# EasyEDA Pro project LED_board.epro

# Schematic Schematic1
Create Date: 2024-09-07; Page Name: P1; Project Name: led_ear; Schematic Name: Schematic1; Update Date: 2024-09-07; Company: 嘉立创EDA; Page Size: A3; Version: V1.0
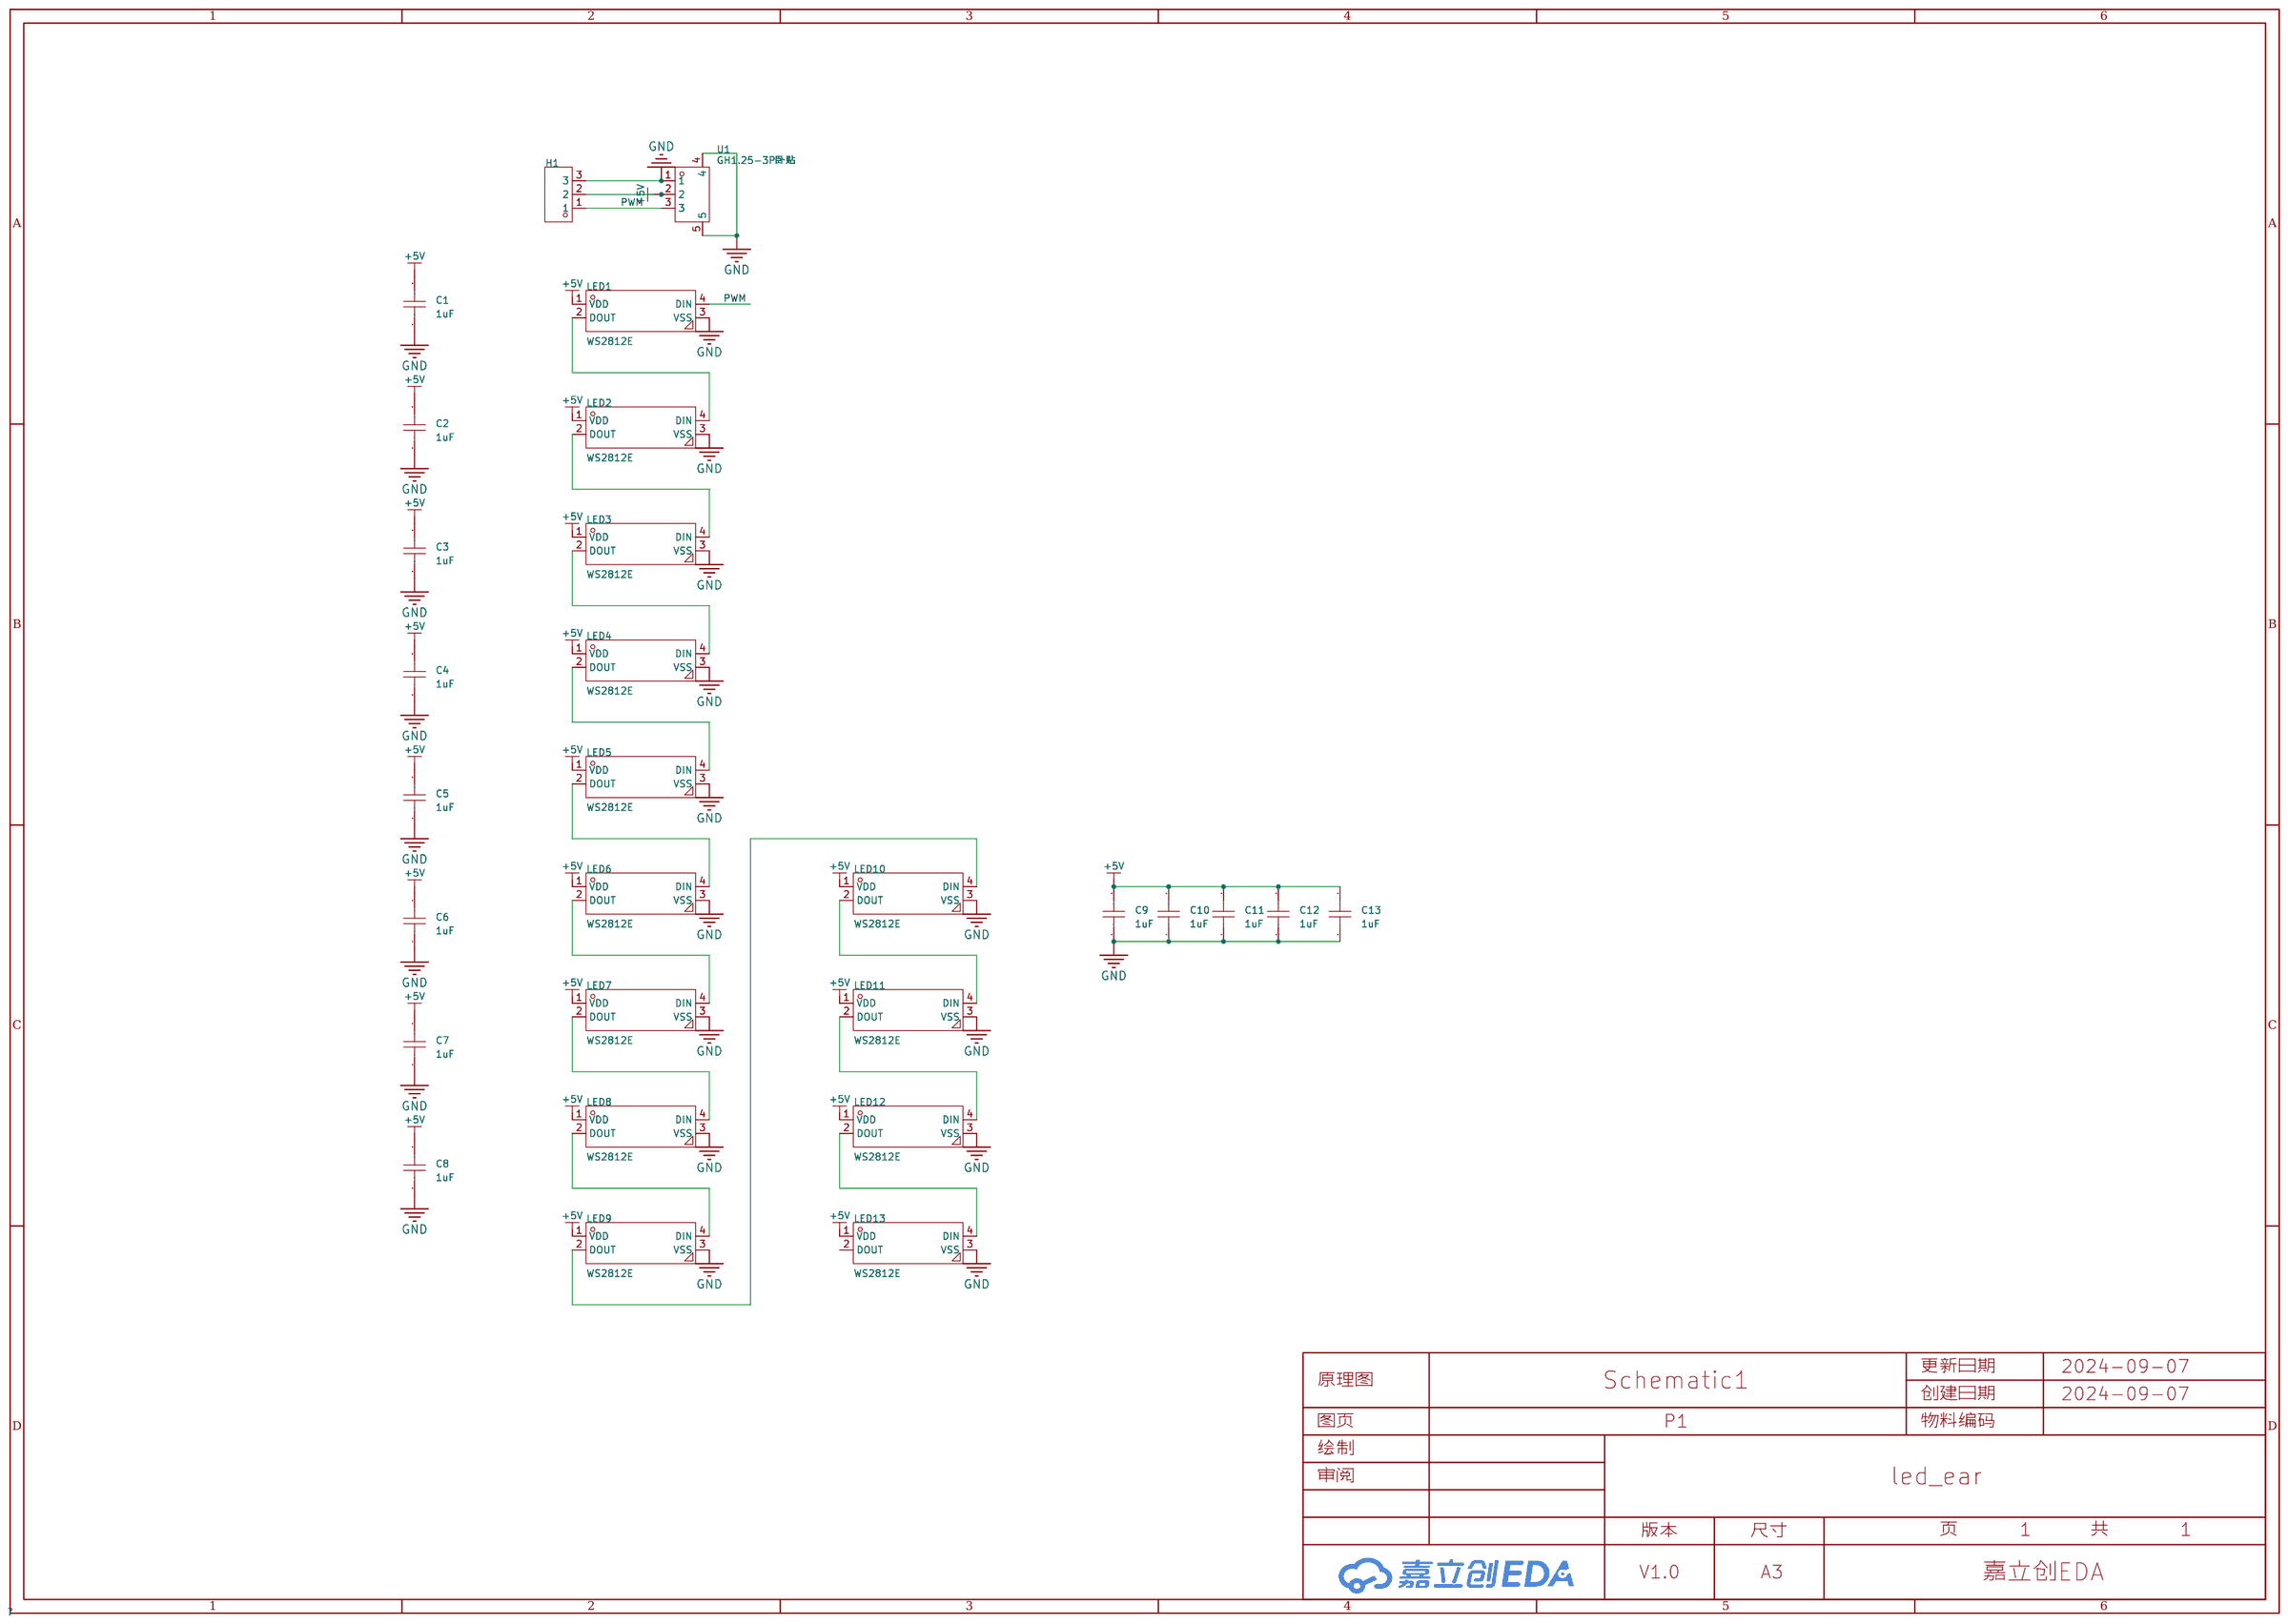
[diagram p0: schematic sheet]

## Parts
C1  1uF  [C0603]
C2  1uF  [C0603]
C3  1uF  [C0603]
C4  1uF  [C0603]
C5  1uF  [C0603]
C6  1uF  [C0603]
C7  1uF  [C0603]
C8  1uF  [C0603]
C9  1uF  [C0603]
C10  1uF  [C0603]
C11  1uF  [C0603]
C12  1uF  [C0603]
C13  1uF  [C0603]
H1  -  [HDR-TH_3P-P2.54-V-M]
LED1  WS2812E  [LED-SMD_4P-L5.0-W5.0-BL_TC5050RGB]
LED2  WS2812E  [LED-SMD_4P-L5.0-W5.0-BL_TC5050RGB]
LED3  WS2812E  [LED-SMD_4P-L5.0-W5.0-BL_TC5050RGB]
LED4  WS2812E  [LED-SMD_4P-L5.0-W5.0-BL_TC5050RGB]
LED5  WS2812E  [LED-SMD_4P-L5.0-W5.0-BL_TC5050RGB]
LED6  WS2812E  [LED-SMD_4P-L5.0-W5.0-BL_TC5050RGB]
LED7  WS2812E  [LED-SMD_4P-L5.0-W5.0-BL_TC5050RGB]
LED8  WS2812E  [LED-SMD_4P-L5.0-W5.0-BL_TC5050RGB]
LED9  WS2812E  [LED-SMD_4P-L5.0-W5.0-BL_TC5050RGB]
LED10  WS2812E  [LED-SMD_4P-L5.0-W5.0-BL_TC5050RGB]
LED11  WS2812E  [LED-SMD_4P-L5.0-W5.0-BL_TC5050RGB]
LED12  WS2812E  [LED-SMD_4P-L5.0-W5.0-BL_TC5050RGB]
LED13  WS2812E  [LED-SMD_4P-L5.0-W5.0-BL_TC5050RGB]
U1  GH1.25-3P卧贴  [CONN-SMD_GH1.25-3P]

## Library data of the parts
C1-C13 = CL10A105KB8NNNC: 容值:1uF;精度:±10%;额定电压:50V;材质(温度系数):X5R;; LCSC Part Name: 1uF ±10% 50V; Supplier Part: C15849; Manufacturer: SAMSUNG(三星); Supplier Footprint: 0603; JLCPCB Part Class: Basic Part; Datasheet: https://atta.szlcsc.com/upload/public/pdf/source/20160218/1457707763339.pdf; Supplier: LCSC; Tolerance: ±10%; Voltage Rated: 50V; Temperature Coefficient: X5R
H1 = HDR-M_2.54_1x3P: Supplier Part: C2937625; Supplier Footprint: 插件
LED1-LED13 = WS2812E: （注意防潮，请查阅规格书中对应具体内容）; Supplier Part: C139127; Manufacturer: worldsemi; Supplier Footprint: SMD5050; JLCPCB Part Class: 扩展库; Datasheet: https://atta.szlcsc.com/upload/public/pdf/source/20191217/C473063_1AFA2F5FD6E31E5FA7E7F342219CDFCF.pdf; Supplier: LCSC
U1 = GH1.25-3P卧贴: Supplier Part: C9900014671; JLCPCB Part Class: 扩展库; Supplier: LCSC

## Nets
+5V: C1.2 C2.2 C3.2 C4.2 C5.2 C6.2 C7.2 C8.2 C9.2 C10.2 C11.2 C12.2 C13.2 H1.2 LED1.1(VDD) LED2.1(VDD) LED3.1(VDD) LED4.1(VDD) LED5.1(VDD) LED6.1(VDD) LED7.1(VDD) LED8.1(VDD) LED9.1(VDD) LED10.1(VDD) LED11.1(VDD) LED12.1(VDD) LED13.1(VDD) U1.2
GND: C1.1 C2.1 C3.1 C4.1 C5.1 C6.1 C7.1 C8.1 C9.1 C10.1 C11.1 C12.1 C13.1 H1.3 LED1.3(VSS) LED2.3(VSS) LED3.3(VSS) LED4.3(VSS) LED5.3(VSS) LED6.3(VSS) LED7.3(VSS) LED8.3(VSS) LED9.3(VSS) LED10.3(VSS) LED11.3(VSS) LED12.3(VSS) LED13.3(VSS) U1.1 U1.4 U1.5
PWM: H1.1 LED1.4(DIN) U1.3
$1N233: LED1.2(DOUT) LED2.4(DIN)
$1N304: LED2.2(DOUT) LED3.4(DIN)
$1N564: LED3.2(DOUT) LED4.4(DIN)
$1N572: LED4.2(DOUT) LED5.4(DIN)
$1N820: LED5.2(DOUT) LED6.4(DIN)
$1N828: LED6.2(DOUT) LED7.4(DIN)
$1N836: LED7.2(DOUT) LED8.4(DIN)
$1N844: LED8.2(DOUT) LED9.4(DIN)
$1N1571: LED10.2(DOUT) LED11.4(DIN)
$1N1579: LED11.2(DOUT) LED12.4(DIN)
$1N1587: LED12.2(DOUT) LED13.4(DIN)
$1N1601: LED9.2(DOUT) LED10.4(DIN)

Not connected (* = marked no-connect by the designer): LED13 2(DOUT)

# Board PCB1
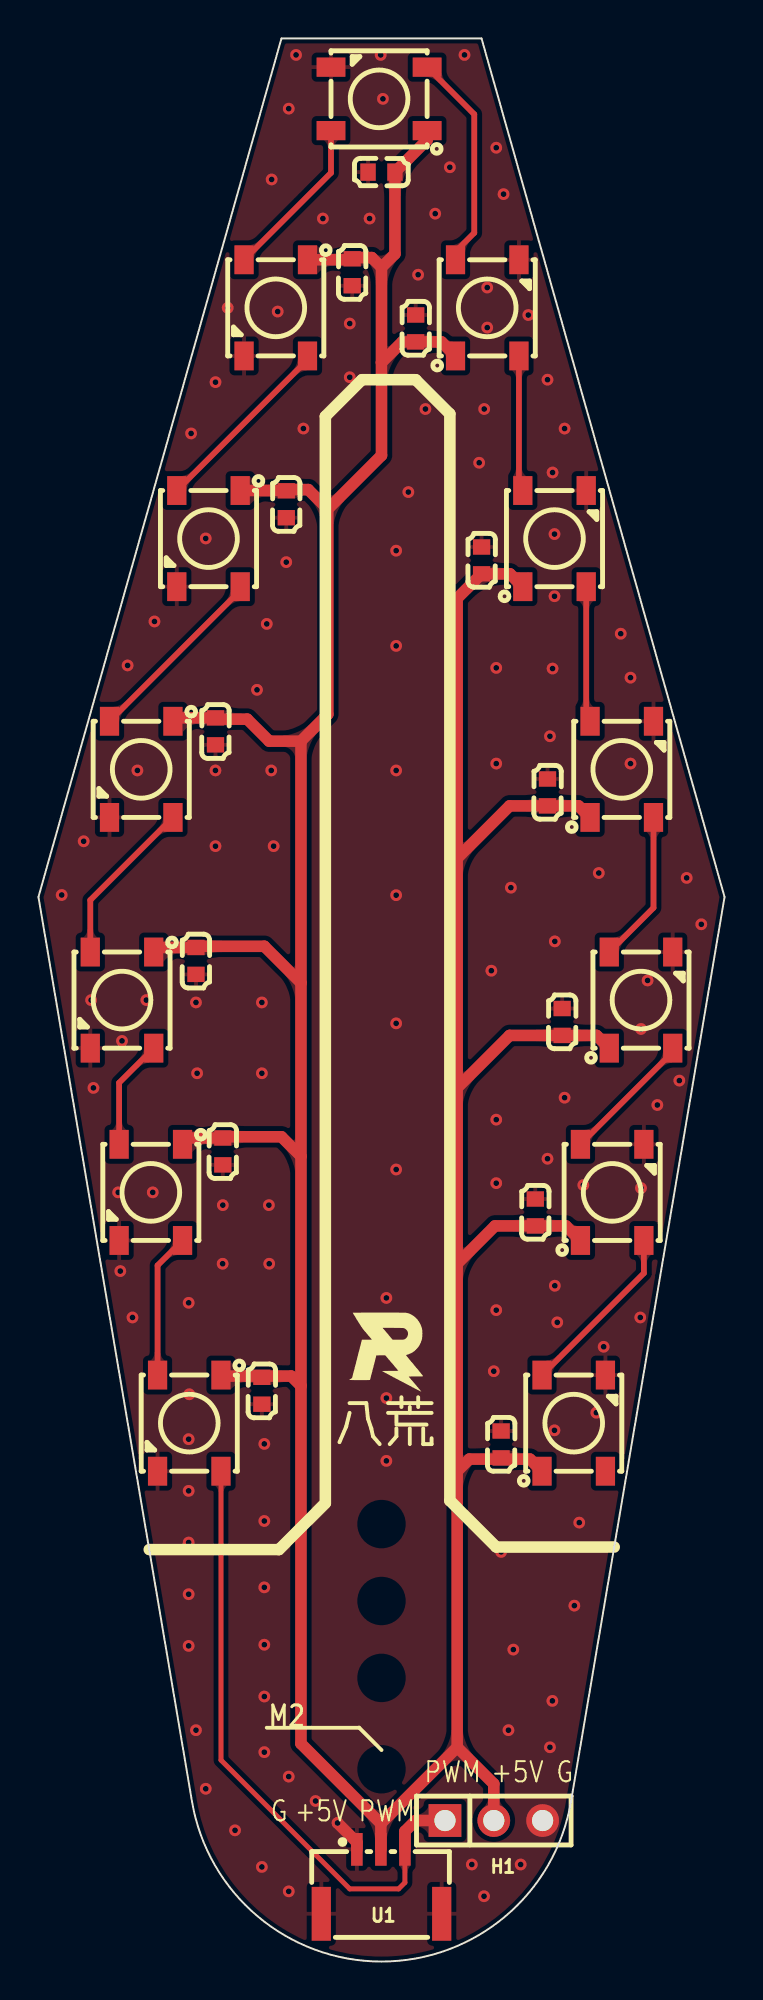
[diagram p1: board, top side]
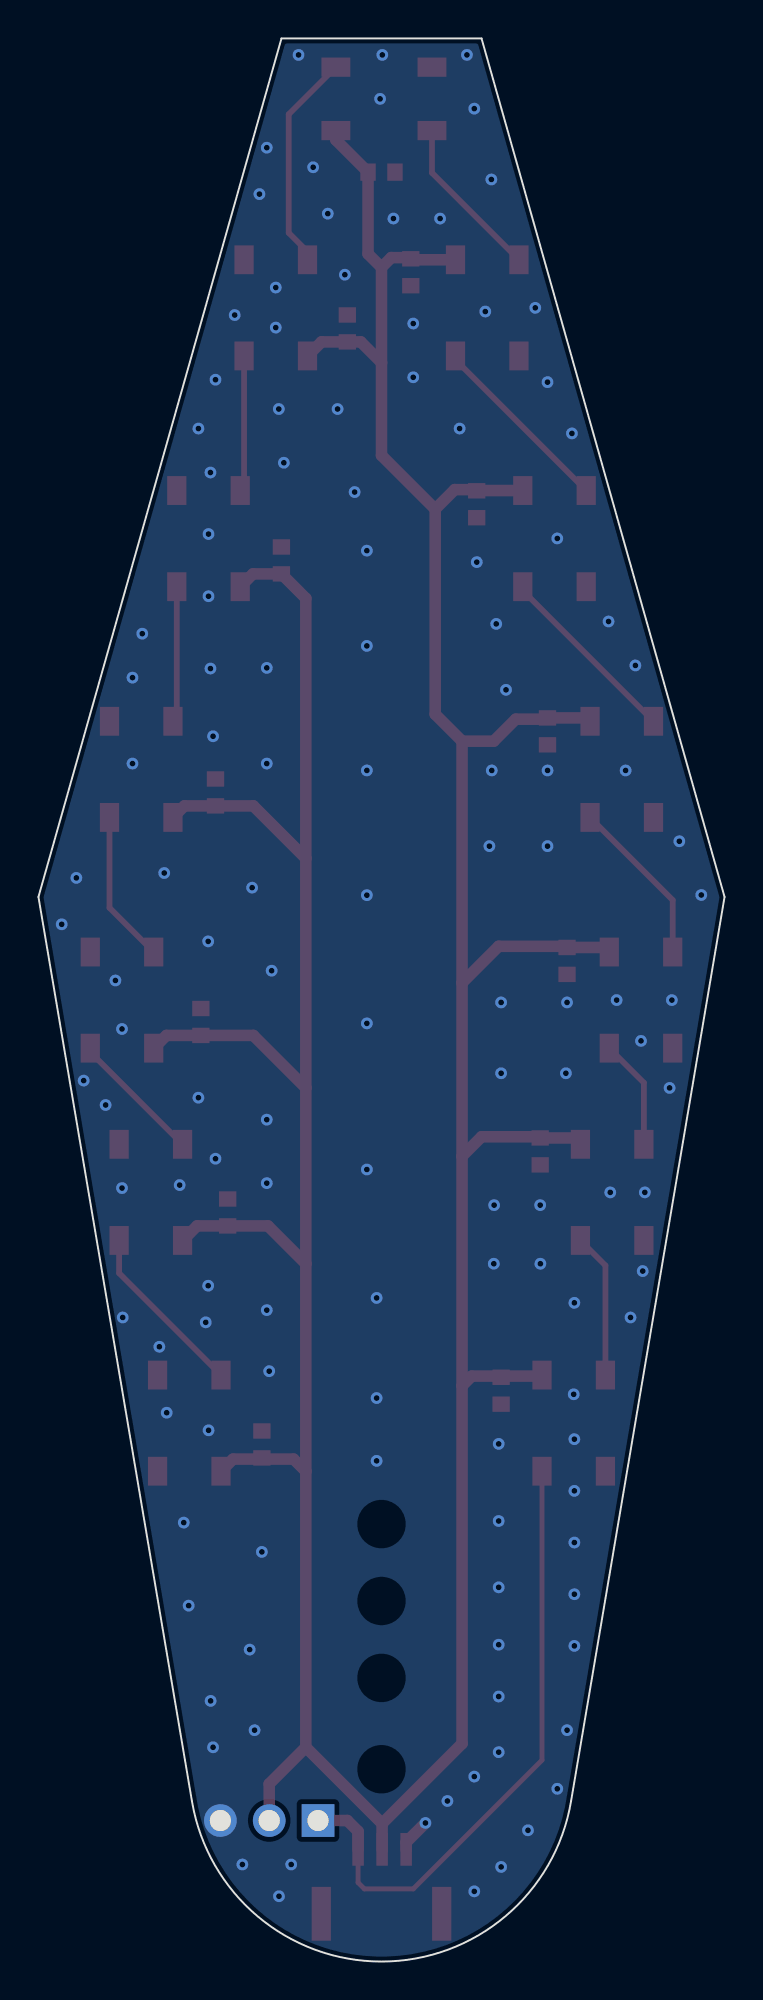
[diagram p2: board, bottom side, seen from below]

Outline 35.69 x 100.01 mm; copper layers: Top Layer, Bottom Layer. Coordinates in mm from the lower left corner of the outline.
Outline path: 0,55.37 7.99,8.33 arc(17.85,0) 27.71,8.33 35.69,55.37 23.05,100.01 12.64,100.01 0,55.37
Stack: Top Layer 0.035mm / Dielectric1 1.51mm FR4 er 4.5 / Bottom Layer 0.035mm

## Design rules (mm)
template: 自定义配置
spacing copperThickness1oz (default): track to track 0.102, other pairs 0.152 to 0.3
spacing copperThickness2oz: track to track 0.203, other pairs 0.152 to 0.3
track width copperThickness1oz (default): min 0.127, default 0.254, max 2.54
track width copperThickness2oz: min 0.203, default 0.254, max 2.54
differential pair differentialPair (default): width min 0.127, default 0.254, max 2.54; gap min 0.152, default 0.152
via viaSize (default): diameter min 0.5, default 0.61, max 10; hole min 0.3, default 0.305, max 6.3

## Placement (name value [footprint] x y rotation side)
C1  1uF  [C0603]  11.62 29.69 90 top
C2  1uF  [C0603]  9.59 42.13 90 top
C3  1uF  [C0603]  8.2 52.04 90 top
C4  1uF  [C0603]  9.21 63.98 90 top
C5  1uF  [C0603]  12.89 75.79 90 top
C6  1uF  [C0603]  16.32 87.85 90 top
C7  1uF  [C0603]  17.85 93.06 0 top
C8  1uF  [C0603]  19.62 84.93 270 top
C9  1uF  [C0603]  23.05 72.87 270 top
C10  1uF  [C0603]  26.48 60.8 270 top
C11  1uF  [C0603]  27.25 48.86 270 top
C12  1uF  [C0603]  24.07 26.89 270 top
C13  1uF  [C0603]  25.85 38.96 270 top
H1  -  [HDR-TH_3P-P2.54-V-M]  23.69 7.33 0 top
LED1  WS2812E  [LED-SMD_4P-L5.0-W5.0-BL_TC5050RGB]  7.85 28 270 top
LED2  WS2812E  [LED-SMD_4P-L5.0-W5.0-BL_TC5050RGB]  5.85 40 270 top
LED3  WS2812E  [LED-SMD_4P-L5.0-W5.0-BL_TC5050RGB]  4.35 50 270 top
LED4  WS2812E  [LED-SMD_4P-L5.0-W5.0-BL_TC5050RGB]  5.35 62 270 top
LED5  WS2812E  [LED-SMD_4P-L5.0-W5.0-BL_TC5050RGB]  8.85 74 270 top
LED6  WS2812E  [LED-SMD_4P-L5.0-W5.0-BL_TC5050RGB]  12.35 86 270 top
LED7  WS2812E  [LED-SMD_4P-L5.0-W5.0-BL_TC5050RGB]  17.72 96.87 180 top
LED8  WS2812E  [LED-SMD_4P-L5.0-W5.0-BL_TC5050RGB]  23.35 86 90 top
LED9  WS2812E  [LED-SMD_4P-L5.0-W5.0-BL_TC5050RGB]  26.85 74 90 top
LED10  WS2812E  [LED-SMD_4P-L5.0-W5.0-BL_TC5050RGB]  30.35 62 90 top
LED11  WS2812E  [LED-SMD_4P-L5.0-W5.0-BL_TC5050RGB]  31.35 50 90 top
LED12  WS2812E  [LED-SMD_4P-L5.0-W5.0-BL_TC5050RGB]  29.85 40 90 top
LED13  WS2812E  [LED-SMD_4P-L5.0-W5.0-BL_TC5050RGB]  27.85 28 90 top
U1  GH1.25-3P卧贴  [CONN-SMD_GH1.25-3P]  17.85 4.16 0 top

## Footprints (pads in the part's own frame, mm; a bottom-side part is the same pattern mirrored in y, then rotated)
C0603
  rect 0.8x0.9 smd: 1(-0.7,0) 2(0.7,0)
CONN-SMD_GH1.25-3P
  rect 0.6x1.7 smd: 1(-1.282,1.675) 2(-0.032,1.675) 3(1.218,1.675)
  rect 1x2.8 smd: 4(-3.132,-1.675) 5(3.132,-1.675)
HDR-TH_3P-P2.54-V-M
  rect 1.7x1.7 hole 1.1: 1(-2.54,0)
  round 1.7 hole 1.1: 2(0,0) 3(2.54,0)
LED-SMD_4P-L5.0-W5.0-BL_TC5050RGB
  rect 1.5x1 smd: 1(-2.5,1.65) 2(-2.5,-1.65) 3(2.5,-1.65) 4(2.5,1.65)

## Nets
As in the schematic.

Pads without a net: LED13 2

## Via types
v1: diameter 0.61, hole 0.305, Top Layer to Bottom Layer, 132 vias

## Routing (per net, layer and track width the routed paths; a pad name or vN(x,y) marks a point on that pad's centre or on a via; arc(x,y) is an arc through that point)
+5V: length 238.9
  Top Layer w0.6: 17.85,88.11 17.34,88.61 16.39,88.61 C6.2 16.27,88.5 LED6.1 ; 17.85,88.11 18.55,88.81 C7.2 20.22,94.73 LED7.1 ; 17.85,88.11 17.85,83.15 ; 17.81,7.17 21.78,11.14 ; 17.81,7.17 13.66,11.33 13.66,29.94 ; 17.81,7.17 U1.2 ; 21.78,11.14 21.78,25.49 ; 21.78,11.14 23.69,9.24 H1.2 ; 21.78,57.37 21.78,70.9 C9.2 24.53,72.17 LED9.1 ; 21.78,57.37 21.78,45.43 ; 21.78,57.37 24.51,60.1 C10.2 28.1,60.1 LED10.1 ; LED5.1 12.88,76.5 C5.2 12.96,76.55 14.04,76.55 15.05,75.53 ; 17.85,83.15 18.93,84.23 C8.2 20.97,84.23 LED8.1 ; 17.85,83.15 17.85,78.33 15.05,75.53 ; 13.66,41.88 12.64,42.89 9.65,42.89 C2.2 7.83,42.83 LED2.1 ; 13.66,41.88 13.66,29.94 ; 13.66,41.88 13.66,50.89 ; 24.01,26.13 C12.2 ; 24.01,26.13 22.42,26.13 21.78,25.49 ; 24.01,26.13 25.57,26.13 LED13.1 ; 21.78,25.49 21.78,36.29 ; 21.78,36.29 21.78,45.43 ; 21.78,36.29 23.75,38.26 C13.2 27.44,38.26 LED12.1 ; 15.05,75.53 15.05,64.86 13.66,63.47 ; 13.66,63.47 12,63.47 10.86,64.61 9.28,64.61 C4.2 7.17,64.68 LED4.1 ; 13.66,63.47 13.66,50.89 ; 11.69,30.45 C1.2 ; 11.69,30.45 9.55,30.45 LED1.1 ; 11.69,30.45 13.15,30.45 13.66,29.94 ; 13.66,50.89 11.75,52.8 8.26,52.8 8.2,52.74 6.23,52.74 LED3.1 ; 21.78,45.43 24.51,48.16 C11.2 29.03,48.16 LED11.1
GND: length 1.8
  Top Layer w0.6: v1(15.56,7.21) 16.57,6.2 U1.1
  vias: v1(1.21,55.47) v1(2.35,58.26) v1(2.74,50) v1(2.86,45.43) v1(4.15,40) v1(4.26,35.91) v1(4.35,47.88) v1(4.64,67.4) v1(4.89,33.5) v1(5.15,61.94) v1(5.61,50) v1(5.95,40) v1(6.04,69.69) v1(7.81,34.26) v1(7.85,29.5) v1(7.81,27.17) v1(7.81,24.48) v1(7.81,21.79) v1(7.81,19.1) v1(7.81,16.42) v1(7.94,79.47) v1(8.2,49.88) v1(8.2,12.03) v1(8.25,46.2) v1(8.7,74.01) v1(8.7,8.98) v1(9.21,82.14) v1(9.21,61.94) v1(9.21,58.01) v1(9.59,39.34) v1(9.58,36.29) v1(9.85,86) v1(10.23,6.83) v1(11.37,66.13) v1(11.62,49.88) v1(11.62,46.2) v1(11.62,4.92) v1(11.75,26.92) v1(11.75,22.91) v1(11.75,19.46) v1(11.75,16.48) v1(11.75,13.78) v1(11.75,10.89) v1(11.88,69.56) v1(11.99,39.34) v1(12,36.29) v1(12.13,92.68) v1(12.11,61.94) v1(12.23,58.01) v1(12.45,85.81) v1(12.89,72.78) v1(13.02,96.36) v1(13.02,9.62) v1(13.02,3.65) v1(13.4,99.15) v1(13.78,79.72) v1(14.42,8.35) v1(14.8,90.65) v1(16.2,85.18) v1(16.2,82.39) v1(17.23,90.65) v1(17.81,99.15) v1(17.92,96.87) v1(18.1,34.51) v1(18.1,29.3) v1(18.1,26.04) v1(18.61,73.37) v1(18.61,68.42) v1(18.61,61.94) v1(18.61,55.46) v1(18.61,48.79) v1(18.61,41.19) v1(19.24,76.42) v1(19.75,87.72) v1(20.13,80.74) v1(20.64,90.9) v1(21.4,93.31) v1(22.16,99.15) v1(22.55,5.05) v1(22.93,77.95) v1(23.19,80.74) v1(23.18,3.4) v1(23.35,87.06) v1(23.35,84.97) v1(23.56,51.53) v1(23.69,30.7) v1(23.82,94.33) v1(23.82,67.28) v1(23.82,62.3) v1(23.82,43.78) v1(23.82,40.48) v1(23.82,33.88) v1(24.07,21.3) v1(24.2,91.92) v1(24.45,12.03) v1(24.58,55.85) v1(24.71,16.22) v1(25.09,5.05) v1(25.48,85.63) v1(26.48,82.26) v1(26.48,41.75) v1(26.61,63.72) v1(26.61,11.14) v1(26.75,77.44) v1(26.75,67.24) v1(26.74,13.56) v1(26.85,74.24) v1(26.85,71) v1(26.86,53.05) v1(26.86,35.15) v1(26.84,27.63) v1(26.99,33.24) v1(27.37,79.72) v1(27.37,44.93) v1(27.88,18.51) v1(28.13,22.83) v1(28.35,40.38) v1(29.02,28.54) v1(29.15,56.61) v1(29.4,31.97) v1(30.29,69.06) v1(30.8,66.77) v1(30.8,62.3) v1(31.35,48.5) v1(31.35,40.22) v1(31.31,33.5) v1(31.69,51.02) v1(32.2,44.54) v1(33.34,45.81) v1(33.72,56.36) v1(34.48,53.94)
PWM: length 32.5
  Top Layer w0.254: U1.3 19.06,4.11 18.74,3.78 16.2,3.78 9.5,10.48 LED1.4
  Top Layer w0.6: U1.3 19.06,6.77 19.62,7.33 H1.1
$1N233: length 7.5
  Top Layer w0.3: LED2.4 6.2,36.2 LED1.2
$1N304: length 5.7
  Top Layer w0.3: LED2.2 4.2,45.7 LED3.4
$1N564: length 8.8
  Top Layer w0.3: LED3.2 2.7,55.2 LED4.4
$1N572: length 9.8
  Top Layer w0.3: LED5.4 10.5,71.3 LED4.2
$1N820: length 9.8
  Top Layer w0.3: LED6.4 14,83.3 LED5.2
$1N828: length 8.6
  Top Layer w0.3: LED7.4 15.22,93.02 LED6.2
$1N836: length 11.4
  Top Layer w0.3: LED8.4 21.7,88.92 22.67,89.9 22.67,96.07 LED7.2
$1N844: length 7.1
  Top Layer w0.3: LED9.4 25,76.7 LED8.2
$1N1571: length 8
  Top Layer w0.3: LED11.4 32,54.8 LED10.2
$1N1579: length 7
  Top Layer w0.3: LED11.2 33,47.3 LED12.4
$1N1587: length 9.2
  Top Layer w0.3: LED13.4 31.5,35.8 LED12.2
$1N1601: length 7.1
  Top Layer w0.3: LED9.2 28.5,64.7 LED10.4

## Copper pours and planes (outline as drawn; the poured copper is in the pictures)
GND on Top Layer: -2.35,103.85 44.52,103.85 44.52,-4.6 -2.35,-4.6
GND on Bottom Layer: -16.44,109.44 59.12,109.44 59.12,-4.1 -16.44,-4.1

Small or netless copper shapes (teardrops, artwork), in the pictures only: 81 on Top Layer

## Text on the board
Top Silkscreen Layer: G | +5V | PWM | M2 | 八荒
